# Altium schematic sheet Controller-Section.SchDoc
size A4; SheetNumber: 2
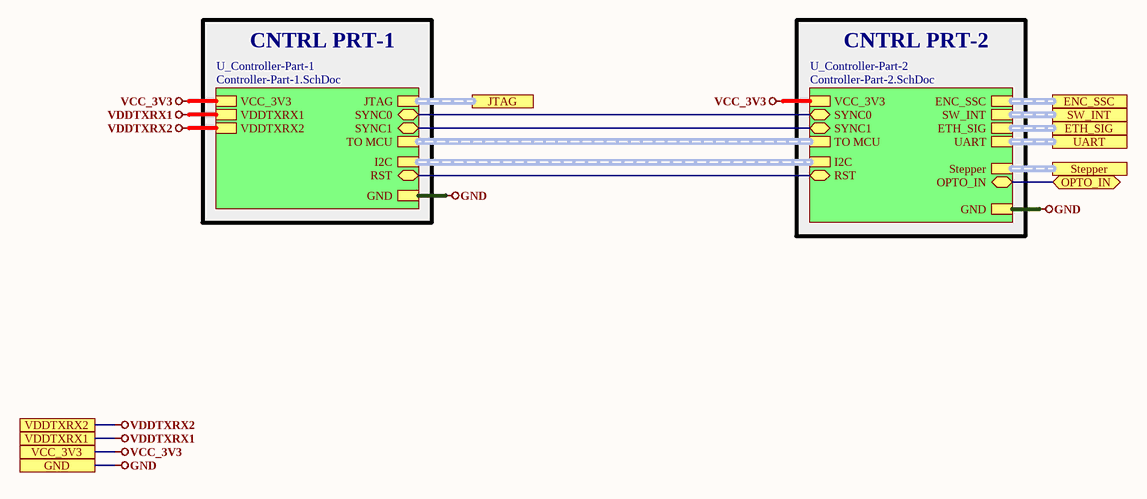
[diagram p0: Controller-Section.SchDoc]

## Sub-sheets
U_Controller-Part-1 = Controller-Part-1.SchDoc: JTAG (harness JTAG), VCC_3V3, GND, TO MCU (harness To MCU), RST (bidir), I2C (harness I2C), VDDTXRX1, VDDTXRX2, SYNC0 (bidir), SYNC1 (bidir)
U_Controller-Part-2 = Controller-Part-2.SchDoc: ENC_SSC (harness ENC_SSC), SW_INT (harness SW_INT), ETH_SIG (harness ETH_SIG), UART (harness UART), TO MCU (harness To MCU), Stepper (harness Stepper), OPTO_IN (bidir), VCC_3V3, GND, RST (bidir), I2C (harness I2C), SYNC0 (bidir), SYNC1 (bidir)

## Ports
ENC_SSC (harness ENC_SSC), ETH_SIG (harness ETH_SIG), GND, JTAG (harness JTAG), OPTO_IN (bidir), Stepper (harness Stepper), SW_INT (harness SW_INT), UART (harness UART), VCC_3V3, VDDTXRX1, VDDTXRX2

## Nets
GND: port GND, sheet U_Controller-Part-1/GND, sheet U_Controller-Part-2/GND
VCC_3V3: port VCC_3V3, sheet U_Controller-Part-1/VCC_3V3, sheet U_Controller-Part-2/VCC_3V3
VDDTXRX1: port VDDTXRX1, sheet U_Controller-Part-1/VDDTXRX1
VDDTXRX2: port VDDTXRX2, sheet U_Controller-Part-1/VDDTXRX2
OPTO_IN: port OPTO_IN, sheet U_Controller-Part-2/OPTO_IN
(unnamed): sheet U_Controller-Part-1/RST, sheet U_Controller-Part-2/RST
(unnamed): sheet U_Controller-Part-1/SYNC0, sheet U_Controller-Part-2/SYNC0
(unnamed): sheet U_Controller-Part-1/SYNC1, sheet U_Controller-Part-2/SYNC1

## Buses and harness runs
harness port ENC_SSC = sheet U_Controller-Part-2/ENC_SSC
harness port ETH_SIG = sheet U_Controller-Part-2/ETH_SIG
harness port JTAG = sheet U_Controller-Part-1/JTAG
harness port Stepper = sheet U_Controller-Part-2/Stepper
harness port SW_INT = sheet U_Controller-Part-2/SW_INT
harness port UART = sheet U_Controller-Part-2/UART
harness sheet U_Controller-Part-1/I2C = sheet U_Controller-Part-2/I2C
harness sheet U_Controller-Part-1/TO MCU = sheet U_Controller-Part-2/TO MCU

## Notes on the sheet
- CNTRL PRT-1
- CNTRL PRT-2